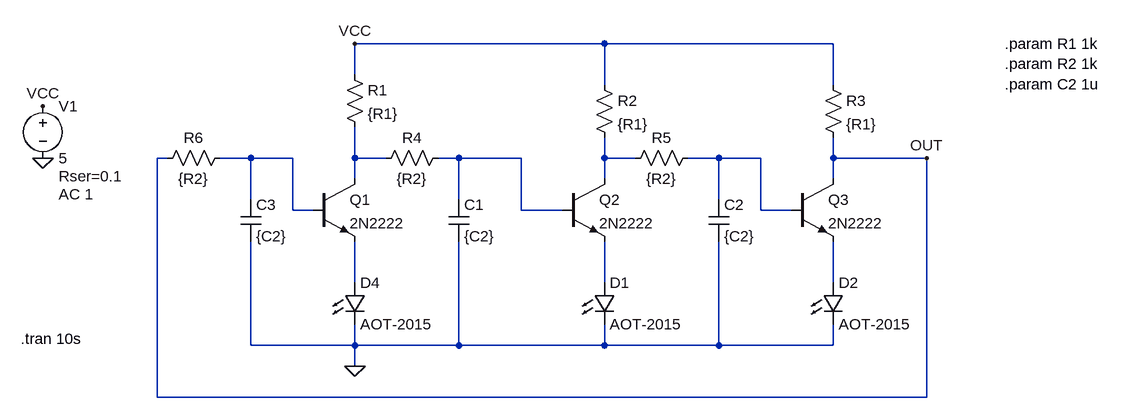
[diagram p0: schematic oscillator_ring.asc]
oscillator_ring.asc, the LTspice schematic file:
Version 4
SHEET 1 1124 680
WIRE 320 -96 -64 -96
WIRE 672 -96 320 -96
WIRE -64 -48 -64 -96
WIRE 320 -32 320 -96
WIRE 672 -32 672 -96
WIRE -352 80 -368 80
WIRE -224 80 -272 80
WIRE -160 80 -224 80
WIRE -64 80 -64 32
WIRE -16 80 -64 80
WIRE 96 80 64 80
WIRE 192 80 96 80
WIRE 320 80 320 48
WIRE 368 80 320 80
WIRE 496 80 448 80
WIRE 560 80 496 80
WIRE 672 80 672 48
WIRE 816 80 672 80
WIRE -64 112 -64 80
WIRE 320 112 320 80
WIRE 672 112 672 80
WIRE -224 144 -224 80
WIRE 96 144 96 80
WIRE 496 144 496 80
WIRE -160 160 -160 80
WIRE -128 160 -160 160
WIRE 192 160 192 80
WIRE 256 160 192 160
WIRE 560 160 560 80
WIRE 608 160 560 160
WIRE -64 272 -64 208
WIRE 320 272 320 208
WIRE 672 272 672 208
WIRE -224 368 -224 208
WIRE -64 368 -64 336
WIRE -64 368 -224 368
WIRE 96 368 96 208
WIRE 96 368 -64 368
WIRE 320 368 320 336
WIRE 320 368 96 368
WIRE 496 368 496 208
WIRE 496 368 320 368
WIRE 672 368 672 336
WIRE 672 368 496 368
WIRE -64 400 -64 368
WIRE -368 448 -368 80
WIRE 816 448 816 80
WIRE 816 448 -368 448
FLAG -64 400 0
FLAG -544 80 0
FLAG -544 0 VCC
FLAG -64 -96 VCC
FLAG 816 80 OUT
SYMBOL npn -128 112 R0
SYMATTR InstName Q1
SYMATTR Value 2N2222
SYMBOL npn 256 112 R0
SYMATTR InstName Q2
SYMATTR Value 2N2222
SYMBOL npn 608 112 R0
SYMATTR InstName Q3
SYMATTR Value 2N2222
SYMBOL voltage -544 -16 R0
WINDOW 123 24 152 Left 2
WINDOW 39 24 124 Left 2
SYMATTR InstName V1
SYMATTR Value 5
SYMATTR Value2 AC 1
SYMATTR SpiceLine Rser=0.1
SYMBOL res -80 -64 R0
SYMATTR InstName R1
SYMATTR Value {R1}
SYMBOL res 304 -48 R0
SYMATTR InstName R2
SYMATTR Value {R1}
SYMBOL res 656 -48 R0
SYMATTR InstName R3
SYMATTR Value {R1}
SYMBOL res 80 64 R90
WINDOW 0 0 56 VBottom 2
WINDOW 3 32 56 VTop 2
SYMATTR InstName R4
SYMATTR Value {R2}
SYMBOL cap 80 144 R0
SYMATTR InstName C1
SYMATTR Value {C2}
SYMBOL res 464 64 R90
WINDOW 0 0 56 VBottom 2
WINDOW 3 32 56 VTop 2
SYMATTR InstName R5
SYMATTR Value {R2}
SYMBOL res -256 64 R90
WINDOW 0 0 56 VBottom 2
WINDOW 3 32 56 VTop 2
SYMATTR InstName R6
SYMATTR Value {R2}
SYMBOL cap 480 144 R0
SYMATTR InstName C2
SYMATTR Value {C2}
SYMBOL cap -240 144 R0
SYMATTR InstName C3
SYMATTR Value {C2}
SYMBOL LED -80 272 R0
SYMATTR InstName D4
SYMATTR Value AOT-2015
SYMBOL LED 304 272 R0
SYMATTR InstName D1
SYMATTR Value AOT-2015
SYMBOL LED 656 272 R0
SYMATTR InstName D2
SYMATTR Value AOT-2015
TEXT 936 -96 Left 2 !.param R1 1k\n.param R2 1k\n.param C2 1u
TEXT -578 358 Left 2 !.tran 10s

The netlist it stands for:
* oscillator_ring.asc
Q1 N002 N001 N006 0 2N2222
Q2 N004 N003 N007 0 2N2222
Q3 OUT N005 N008 0 2N2222
V1 VCC 0 5 AC 1 Rser=0.1
R1 VCC N002 {R1}
R2 VCC N004 {R1}
R3 VCC OUT {R1}
R4 N003 N002 {R2}
C1 N003 0 {C2}
R5 N005 N004 {R2}
R6 N001 OUT {R2}
C2 N005 0 {C2}
C3 N001 0 {C2}
D4 N006 0 AOT-2015
D1 N007 0 AOT-2015
D2 N008 0 AOT-2015
.model D D
.lib standard.dio
.model NPN NPN
.model PNP PNP
.lib standard.bjt
.param R1 1k
.param R2 1k
.param C2 1u
.tran 10s
.backanno
.end